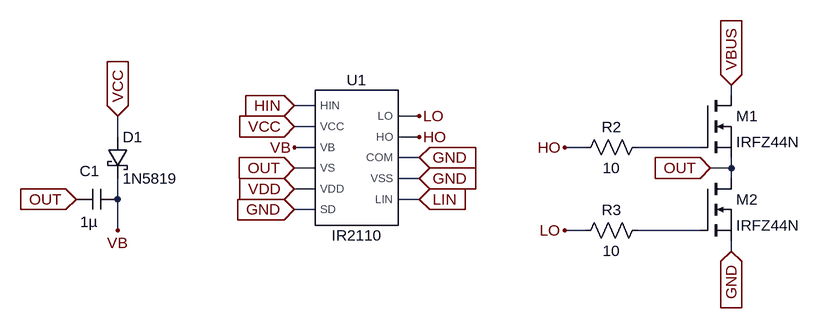
[diagram p0: schematic half-bridge.asc]
half-bridge.asc, the LTspice schematic file:
Version 4.1
SHEET 1 1748 680
WIRE 1392 -560 1392 -576
WIRE 752 -544 720 -544
WIRE 912 -528 880 -528
WIRE 752 -512 720 -512
WIRE 448 -496 448 -528
WIRE 912 -496 880 -496
WIRE 752 -480 720 -480
WIRE 1168 -480 1136 -480
WIRE 1344 -480 1248 -480
WIRE 912 -464 880 -464
WIRE 752 -448 720 -448
WIRE 1392 -448 1392 -464
WIRE 1392 -448 1360 -448
WIRE 912 -432 880 -432
WIRE 1392 -432 1392 -448
WIRE 752 -416 720 -416
WIRE 448 -400 448 -432
WIRE 912 -400 880 -400
WIRE 752 -384 720 -384
WIRE 448 -352 448 -400
WIRE 1168 -352 1136 -352
WIRE 1344 -352 1248 -352
WIRE 1392 -320 1392 -336
FLAG 720 -512 VCC
IOPIN 720 -512 In
FLAG 912 -496 HO
FLAG 912 -528 LO
FLAG 720 -544 HIN
IOPIN 720 -544 In
FLAG 912 -400 LIN
IOPIN 912 -400 In
FLAG 1392 -320 GND
IOPIN 1392 -320 In
FLAG 1392 -576 VBUS
IOPIN 1392 -576 In
FLAG 1136 -352 LO
FLAG 1136 -480 HO
FLAG 720 -416 VDD
IOPIN 720 -416 In
FLAG 1360 -448 OUT
IOPIN 1360 -448 In
FLAG 720 -448 OUT
IOPIN 720 -448 In
FLAG 720 -480 VB
FLAG 448 -528 VCC
IOPIN 448 -528 In
FLAG 448 -352 VB
FLAG 384 -400 OUT
IOPIN 384 -400 In
FLAG 720 -384 GND
IOPIN 720 -384 In
FLAG 912 -464 GND
IOPIN 912 -464 In
FLAG 912 -432 GND
IOPIN 912 -432 In
SYMBOL IR2110 816 -464 M0
SYMATTR InstName U1
SYMBOL nmos 1344 -560 R0
SYMATTR InstName M1
SYMATTR Value IRFZ44N
SYMBOL nmos 1344 -432 R0
SYMATTR InstName M2
SYMATTR Value IRFZ44N
SYMBOL res 1264 -496 R90
WINDOW 0 0 56 VBottom 2
WINDOW 3 32 56 VTop 2
SYMATTR InstName R2
SYMATTR Value 10
SYMBOL res 1264 -368 R90
WINDOW 0 0 56 VBottom 2
WINDOW 3 32 56 VTop 2
SYMATTR InstName R3
SYMATTR Value 10
SYMBOL schottky 432 -496 R0
SYMATTR InstName D1
SYMATTR Value 1N5819
SYMATTR Description Diode
SYMATTR Type diode
SYMBOL cap 448 -416 R90
WINDOW 0 -12 43 VBottom 2
WINDOW 3 35 44 VTop 2
SYMATTR InstName C1
SYMATTR Value 1µ

The netlist it stands for:
* half-bridge.asc
X§U1 LO HO GND GND LIN HIN VCC VB OUT VDD GND IR2110  ; pins LO HO COM VSS LIN HIN VCC VB VS VDD SD
M1 VBUS N001 OUT OUT IRFZ44N
M2 OUT N002 GND GND IRFZ44N
R2 N001 HO 10
R3 N002 LO 10
D1 VCC VB 1N5819
C1 VB OUT 1µ
.model D D
.lib standard.dio
.model NMOS NMOS
.model PMOS PMOS
.lib standard.mos
.lib IR2110.lib
.backanno
.end